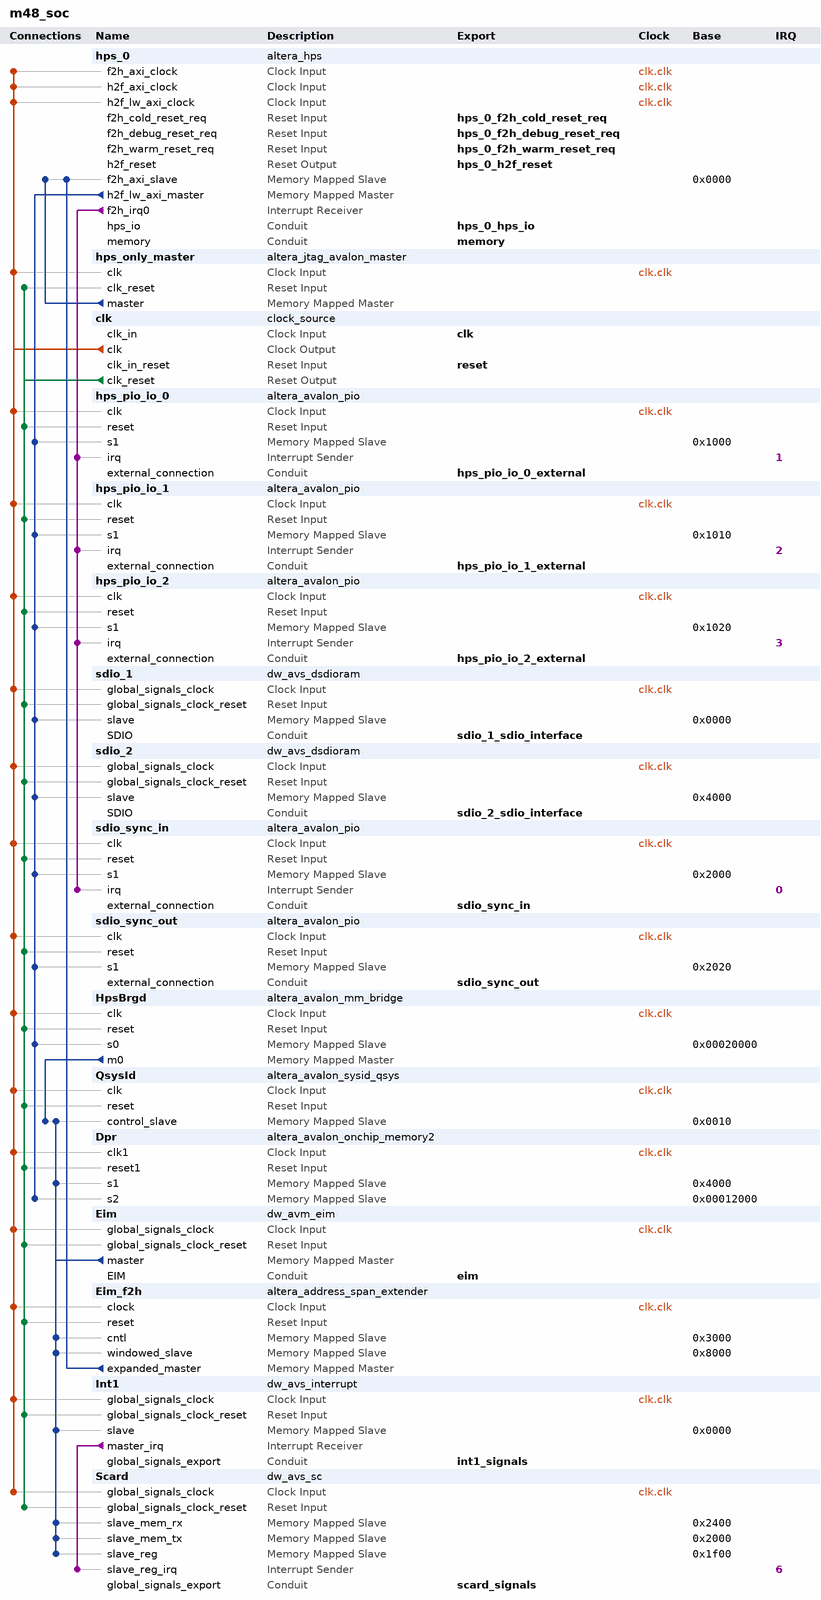
[diagram p0: system contents]
# Platform Designer (Qsys) system m48_soc, Cyclone V 5CSEBA4U23C7
# Parameters at their usual value, and those the tool derives, are not listed.
package require -exact qsys 14.1
create_system m48_soc
set_project_property DEVICE_FAMILY {Cyclone V}
set_project_property DEVICE 5CSEBA4U23C7

add_instance hps_0 altera_hps 14.1
set_instance_parameter_value hps_0 EMAC0_Mode RGMII
set_instance_parameter_value hps_0 EMAC0_PinMuxing {HPS I/O Set 0}
set_instance_parameter_value hps_0 EMAC1_Mode N/A
set_instance_parameter_value hps_0 EMAC1_PinMuxing Unused
set_instance_parameter_value hps_0 F2SCLK_COLDRST_Enable true
set_instance_parameter_value hps_0 F2SCLK_DBGRST_Enable true
set_instance_parameter_value hps_0 F2SCLK_WARMRST_Enable true
set_instance_parameter_value hps_0 F2SINTERRUPT_Enable true
set_instance_parameter_value hps_0 F2S_Width 2
set_instance_parameter_value hps_0 FPGA_PERIPHERAL_OUTPUT_CLOCK_FREQ_EMAC0_GTX_CLK 100
set_instance_parameter_value hps_0 FPGA_PERIPHERAL_OUTPUT_CLOCK_FREQ_EMAC0_MD_CLK 100
set_instance_parameter_value hps_0 FPGA_PERIPHERAL_OUTPUT_CLOCK_FREQ_EMAC1_GTX_CLK 100
set_instance_parameter_value hps_0 FPGA_PERIPHERAL_OUTPUT_CLOCK_FREQ_EMAC1_MD_CLK 100
set_instance_parameter_value hps_0 HLGPI_Enable true
set_instance_parameter_value hps_0 HPS_PROTOCOL DDR3
set_instance_parameter_value hps_0 I2C0_Mode I2C
set_instance_parameter_value hps_0 I2C0_PinMuxing {HPS I/O Set 1}
set_instance_parameter_value hps_0 I2C1_Mode N/A
set_instance_parameter_value hps_0 I2C1_PinMuxing Unused
set_instance_parameter_value hps_0 LWH2F_Enable true
set_instance_parameter_value hps_0 MEM_BANKADDR_WIDTH 3
set_instance_parameter_value hps_0 MEM_CLK_FREQ 400.0
set_instance_parameter_value hps_0 MEM_COL_ADDR_WIDTH 10
set_instance_parameter_value hps_0 MEM_DQ_WIDTH 32
set_instance_parameter_value hps_0 MEM_DRV_STR RZQ/6
set_instance_parameter_value hps_0 MEM_ROW_ADDR_WIDTH 15
set_instance_parameter_value hps_0 MEM_RTT_NOM RZQ/6
set_instance_parameter_value hps_0 MEM_RTT_WR {Dynamic ODT off}
set_instance_parameter_value hps_0 MEM_TCL 7
set_instance_parameter_value hps_0 MEM_TFAW_NS 40.0
set_instance_parameter_value hps_0 MEM_TINIT_US 700
set_instance_parameter_value hps_0 MEM_TRAS_NS 35.0
set_instance_parameter_value hps_0 MEM_TRCD_NS 13.91
set_instance_parameter_value hps_0 MEM_TRFC_NS 260.0
set_instance_parameter_value hps_0 MEM_TRP_NS 13.91
set_instance_parameter_value hps_0 MEM_TRRD_NS 10.0
set_instance_parameter_value hps_0 MEM_TRTP_NS 10.0
set_instance_parameter_value hps_0 MEM_VENDOR Micron
set_instance_parameter_value hps_0 MEM_WTCL 6
set_instance_parameter_value hps_0 QSPI_Mode {1 SS}
set_instance_parameter_value hps_0 QSPI_PinMuxing {HPS I/O Set 0}
set_instance_parameter_value hps_0 REF_CLK_FREQ 25.0
set_instance_parameter_value hps_0 S2F_Width 1
set_instance_parameter_value hps_0 SDIO_Mode {4-bit Data}
set_instance_parameter_value hps_0 SDIO_PinMuxing {HPS I/O Set 0}
set_instance_parameter_value hps_0 SPIM1_Mode N/A
set_instance_parameter_value hps_0 SPIM1_PinMuxing Unused
set_instance_parameter_value hps_0 STM_Enable false
set_instance_parameter_value hps_0 TIMING_BOARD_AC_SKEW 0.02
set_instance_parameter_value hps_0 TIMING_BOARD_AC_TO_CK_SKEW 0.0
set_instance_parameter_value hps_0 TIMING_BOARD_DQ_TO_DQS_SKEW 0.0
set_instance_parameter_value hps_0 TIMING_BOARD_MAX_CK_DELAY 0.2
set_instance_parameter_value hps_0 TIMING_BOARD_MAX_DQS_DELAY 0.2
set_instance_parameter_value hps_0 TIMING_BOARD_SKEW_BETWEEN_DQS 0.02
set_instance_parameter_value hps_0 TIMING_BOARD_SKEW_CKDQS_DIMM_MAX 0.01
set_instance_parameter_value hps_0 TIMING_BOARD_SKEW_CKDQS_DIMM_MIN -0.01
set_instance_parameter_value hps_0 TIMING_BOARD_SKEW_WITHIN_DQS 0.02
set_instance_parameter_value hps_0 TIMING_TDH 200
set_instance_parameter_value hps_0 TIMING_TDQSCK 225
set_instance_parameter_value hps_0 TIMING_TDQSQ 100
set_instance_parameter_value hps_0 TIMING_TDQSS 0.27
set_instance_parameter_value hps_0 TIMING_TDS 200
set_instance_parameter_value hps_0 TIMING_TDSH 0.18
set_instance_parameter_value hps_0 TIMING_TDSS 0.18
set_instance_parameter_value hps_0 TIMING_TIH 200
set_instance_parameter_value hps_0 TIMING_TIS 200
set_instance_parameter_value hps_0 TIMING_TQSH 0.4
set_instance_parameter_value hps_0 TRACE_Mode HPS
set_instance_parameter_value hps_0 TRACE_PinMuxing {HPS I/O Set 0}
set_instance_parameter_value hps_0 UART0_Mode {No Flow Control}
set_instance_parameter_value hps_0 UART0_PinMuxing {HPS I/O Set 2}
set_instance_parameter_value hps_0 USB1_Mode N/A
set_instance_parameter_value hps_0 USB1_PinMuxing Unused
set_instance_parameter_value hps_0 desired_cfg_clk_mhz 100.0
set_instance_parameter_value hps_0 desired_qspi_clk_mhz 400.0

add_instance hps_only_master altera_jtag_avalon_master 14.1

add_instance clk clock_source 14.1
set_instance_parameter_value clk clockFrequency 50000000

add_instance hps_pio_io_0 altera_avalon_pio 14.1
set_instance_parameter_value hps_pio_io_0 bitClearingEdgeCapReg true
set_instance_parameter_value hps_pio_io_0 direction Bidir
set_instance_parameter_value hps_pio_io_0 generateIRQ true
set_instance_parameter_value hps_pio_io_0 width 32

add_instance hps_pio_io_1 altera_avalon_pio 14.1
set_instance_parameter_value hps_pio_io_1 bitClearingEdgeCapReg true
set_instance_parameter_value hps_pio_io_1 direction Bidir
set_instance_parameter_value hps_pio_io_1 generateIRQ true
set_instance_parameter_value hps_pio_io_1 width 32

add_instance hps_pio_io_2 altera_avalon_pio 14.1
set_instance_parameter_value hps_pio_io_2 bitClearingEdgeCapReg true
set_instance_parameter_value hps_pio_io_2 direction Bidir
set_instance_parameter_value hps_pio_io_2 generateIRQ true
set_instance_parameter_value hps_pio_io_2 width 32

add_instance sdio_1 dw_avs_dsdioram 1.0
set_instance_parameter_value sdio_1 BIG_ENDIAN 0
set_instance_parameter_value sdio_1 CRC_CHECK 0
set_instance_parameter_value sdio_1 ILLEGAL_CMD 1

add_instance sdio_2 dw_avs_dsdioram 1.0
set_instance_parameter_value sdio_2 BIG_ENDIAN 0
set_instance_parameter_value sdio_2 CRC_CHECK 0
set_instance_parameter_value sdio_2 ILLEGAL_CMD 1

add_instance sdio_sync_in altera_avalon_pio 14.1
set_instance_parameter_value sdio_sync_in bitClearingEdgeCapReg true
set_instance_parameter_value sdio_sync_in captureEdge true
set_instance_parameter_value sdio_sync_in direction Input
set_instance_parameter_value sdio_sync_in generateIRQ true
set_instance_parameter_value sdio_sync_in irqType EDGE
set_instance_parameter_value sdio_sync_in width 2

add_instance sdio_sync_out altera_avalon_pio 14.1
set_instance_parameter_value sdio_sync_out bitModifyingOutReg true
set_instance_parameter_value sdio_sync_out direction Output
set_instance_parameter_value sdio_sync_out resetValue 3
set_instance_parameter_value sdio_sync_out width 2

add_instance HpsBrgd altera_avalon_mm_bridge 14.1
set_instance_parameter_value HpsBrgd ADDRESS_UNITS SYMBOLS
set_instance_parameter_value HpsBrgd ADDRESS_WIDTH 12
set_instance_parameter_value HpsBrgd DATA_WIDTH 32
set_instance_parameter_value HpsBrgd MAX_PENDING_RESPONSES 1
set_instance_parameter_value HpsBrgd PIPELINE_COMMAND 0
set_instance_parameter_value HpsBrgd PIPELINE_RESPONSE 0
set_instance_parameter_value HpsBrgd USE_AUTO_ADDRESS_WIDTH 1

add_instance QsysId altera_avalon_sysid_qsys 14.1
set_instance_parameter_value QsysId id 1207963661

add_instance Dpr altera_avalon_onchip_memory2 14.1
set_instance_parameter_value Dpr dataWidth 32
set_instance_parameter_value Dpr dualPort true
set_instance_parameter_value Dpr initMemContent false
set_instance_parameter_value Dpr initializationFileName onchip_mem.hex
set_instance_parameter_value Dpr memorySize 8192
set_instance_parameter_value Dpr readDuringWriteMode OLD_DATA
set_instance_parameter_value Dpr singleClockOperation true

add_instance Eim dw_avm_eim 1.0
set_instance_parameter_value Eim BIG_ENDIAN 0

add_instance Eim_f2h altera_address_span_extender 14.1
set_instance_parameter_value Eim_f2h BURSTCOUNT_WIDTH 1
set_instance_parameter_value Eim_f2h DATA_WIDTH 32
set_instance_parameter_value Eim_f2h MASTER_ADDRESS_DEF 0
set_instance_parameter_value Eim_f2h MAX_PENDING_READS 1
set_instance_parameter_value Eim_f2h SLAVE_ADDRESS_WIDTH 12
set_instance_parameter_value Eim_f2h TERMINATE_SLAVE_PORT false

add_instance Int1 dw_avs_interrupt 1.0
set_instance_parameter_value Int1 ADR_INT_MASK 4
set_instance_parameter_value Int1 ADR_INT_PEND 0
set_instance_parameter_value Int1 ADR_MASTER_INT_PEND 8
set_instance_parameter_value Int1 BIG_ENDIAN 0

add_instance Scard dw_avs_sc 1.0
set_instance_parameter_value Scard ADR_BWT 12
set_instance_parameter_value Scard ADR_CLOCK_DIV 0
set_instance_parameter_value Scard ADR_CMC 36
set_instance_parameter_value Scard ADR_CWT 8
set_instance_parameter_value Scard ADR_ETU 4
set_instance_parameter_value Scard ADR_GWT 24
set_instance_parameter_value Scard ADR_I 28
set_instance_parameter_value Scard ADR_IM 32
set_instance_parameter_value Scard ADR_NR_RX 16
set_instance_parameter_value Scard ADR_NR_TX 20
set_instance_parameter_value Scard BIG_ENDIAN 0
set_instance_parameter_value Scard DEFAULT_BWT_VAL 971
set_instance_parameter_value Scard DEFAULT_CLK_DIV 66
set_instance_parameter_value Scard DEFAULT_CWT_VAL 22
set_instance_parameter_value Scard DEFAULT_ETU_DIV_VAL 372
set_instance_parameter_value Scard DEFAULT_GUARD_TIME 2

# connections
add_connection clk.clk Dpr.clk1 clock
add_connection clk.clk Eim.global_signals_clock clock
add_connection clk.clk Eim_f2h.clock clock
add_connection clk.clk hps_0.f2h_axi_clock clock
add_connection clk.clk hps_0.h2f_axi_clock clock
add_connection clk.clk hps_0.h2f_lw_axi_clock clock
add_connection clk.clk hps_only_master.clk clock
add_connection clk.clk hps_pio_io_0.clk clock
add_connection clk.clk hps_pio_io_1.clk clock
add_connection clk.clk hps_pio_io_2.clk clock
add_connection clk.clk HpsBrgd.clk clock
add_connection clk.clk Int1.global_signals_clock clock
add_connection clk.clk QsysId.clk clock
add_connection clk.clk Scard.global_signals_clock clock
add_connection clk.clk sdio_1.global_signals_clock clock
add_connection clk.clk sdio_2.global_signals_clock clock
add_connection clk.clk sdio_sync_in.clk clock
add_connection clk.clk sdio_sync_out.clk clock
add_connection clk.clk_reset Dpr.reset1 reset
add_connection clk.clk_reset Eim.global_signals_clock_reset reset
add_connection clk.clk_reset Eim_f2h.reset reset
add_connection clk.clk_reset hps_only_master.clk_reset reset
add_connection clk.clk_reset hps_pio_io_0.reset reset
add_connection clk.clk_reset hps_pio_io_1.reset reset
add_connection clk.clk_reset hps_pio_io_2.reset reset
add_connection clk.clk_reset HpsBrgd.reset reset
add_connection clk.clk_reset Int1.global_signals_clock_reset reset
add_connection clk.clk_reset QsysId.reset reset
add_connection clk.clk_reset Scard.global_signals_clock_reset reset
add_connection clk.clk_reset sdio_1.global_signals_clock_reset reset
add_connection clk.clk_reset sdio_2.global_signals_clock_reset reset
add_connection clk.clk_reset sdio_sync_in.reset reset
add_connection clk.clk_reset sdio_sync_out.reset reset
add_connection Eim.master Dpr.s1 avalon
set_connection_parameter_value Eim.master/Dpr.s1 baseAddress 0x4000
add_connection Eim.master Eim_f2h.cntl avalon
set_connection_parameter_value Eim.master/Eim_f2h.cntl baseAddress 0x3000
add_connection Eim.master Eim_f2h.windowed_slave avalon
set_connection_parameter_value Eim.master/Eim_f2h.windowed_slave baseAddress 0x8000
add_connection Eim.master Int1.slave avalon
set_connection_parameter_value Eim.master/Int1.slave baseAddress 0x0000
add_connection Eim.master QsysId.control_slave avalon
set_connection_parameter_value Eim.master/QsysId.control_slave baseAddress 0x0010
add_connection Eim.master Scard.slave_mem_rx avalon
set_connection_parameter_value Eim.master/Scard.slave_mem_rx baseAddress 0x2400
add_connection Eim.master Scard.slave_mem_tx avalon
set_connection_parameter_value Eim.master/Scard.slave_mem_tx baseAddress 0x2000
add_connection Eim.master Scard.slave_reg avalon
set_connection_parameter_value Eim.master/Scard.slave_reg baseAddress 0x1f00
add_connection Eim_f2h.expanded_master hps_0.f2h_axi_slave avalon
set_connection_parameter_value Eim_f2h.expanded_master/hps_0.f2h_axi_slave baseAddress 0x0000
add_connection hps_0.h2f_lw_axi_master Dpr.s2 avalon
set_connection_parameter_value hps_0.h2f_lw_axi_master/Dpr.s2 baseAddress 0x00012000
add_connection hps_0.h2f_lw_axi_master hps_pio_io_0.s1 avalon
set_connection_parameter_value hps_0.h2f_lw_axi_master/hps_pio_io_0.s1 baseAddress 0x1000
add_connection hps_0.h2f_lw_axi_master hps_pio_io_1.s1 avalon
set_connection_parameter_value hps_0.h2f_lw_axi_master/hps_pio_io_1.s1 baseAddress 0x1010
add_connection hps_0.h2f_lw_axi_master hps_pio_io_2.s1 avalon
set_connection_parameter_value hps_0.h2f_lw_axi_master/hps_pio_io_2.s1 baseAddress 0x1020
add_connection hps_0.h2f_lw_axi_master HpsBrgd.s0 avalon
set_connection_parameter_value hps_0.h2f_lw_axi_master/HpsBrgd.s0 baseAddress 0x00020000
add_connection hps_0.h2f_lw_axi_master sdio_1.slave avalon
set_connection_parameter_value hps_0.h2f_lw_axi_master/sdio_1.slave baseAddress 0x0000
add_connection hps_0.h2f_lw_axi_master sdio_2.slave avalon
set_connection_parameter_value hps_0.h2f_lw_axi_master/sdio_2.slave baseAddress 0x4000
add_connection hps_0.h2f_lw_axi_master sdio_sync_in.s1 avalon
set_connection_parameter_value hps_0.h2f_lw_axi_master/sdio_sync_in.s1 baseAddress 0x2000
add_connection hps_0.h2f_lw_axi_master sdio_sync_out.s1 avalon
set_connection_parameter_value hps_0.h2f_lw_axi_master/sdio_sync_out.s1 baseAddress 0x2020
add_connection hps_only_master.master hps_0.f2h_axi_slave avalon
set_connection_parameter_value hps_only_master.master/hps_0.f2h_axi_slave baseAddress 0x0000
add_connection HpsBrgd.m0 QsysId.control_slave avalon
set_connection_parameter_value HpsBrgd.m0/QsysId.control_slave baseAddress 0x0010
add_connection hps_0.f2h_irq0 hps_pio_io_0.irq interrupt
set_connection_parameter_value hps_0.f2h_irq0/hps_pio_io_0.irq irqNumber 1
add_connection hps_0.f2h_irq0 hps_pio_io_1.irq interrupt
set_connection_parameter_value hps_0.f2h_irq0/hps_pio_io_1.irq irqNumber 2
add_connection hps_0.f2h_irq0 hps_pio_io_2.irq interrupt
set_connection_parameter_value hps_0.f2h_irq0/hps_pio_io_2.irq irqNumber 3
add_connection hps_0.f2h_irq0 sdio_sync_in.irq interrupt
set_connection_parameter_value hps_0.f2h_irq0/sdio_sync_in.irq irqNumber 0
add_connection Int1.master_irq Scard.slave_reg_irq interrupt
set_connection_parameter_value Int1.master_irq/Scard.slave_reg_irq irqNumber 6

# exported interfaces
add_interface clk clock sink
set_interface_property clk EXPORT_OF clk.clk_in
add_interface eim conduit end
set_interface_property eim EXPORT_OF Eim.EIM
add_interface hps_0_f2h_cold_reset_req reset sink
set_interface_property hps_0_f2h_cold_reset_req EXPORT_OF hps_0.f2h_cold_reset_req
add_interface hps_0_f2h_debug_reset_req reset sink
set_interface_property hps_0_f2h_debug_reset_req EXPORT_OF hps_0.f2h_debug_reset_req
add_interface hps_0_f2h_warm_reset_req reset sink
set_interface_property hps_0_f2h_warm_reset_req EXPORT_OF hps_0.f2h_warm_reset_req
add_interface hps_0_h2f_reset reset source
set_interface_property hps_0_h2f_reset EXPORT_OF hps_0.h2f_reset
add_interface hps_0_hps_io conduit end
set_interface_property hps_0_hps_io EXPORT_OF hps_0.hps_io
add_interface hps_pio_io_0_external conduit end
set_interface_property hps_pio_io_0_external EXPORT_OF hps_pio_io_0.external_connection
add_interface hps_pio_io_1_external conduit end
set_interface_property hps_pio_io_1_external EXPORT_OF hps_pio_io_1.external_connection
add_interface hps_pio_io_2_external conduit end
set_interface_property hps_pio_io_2_external EXPORT_OF hps_pio_io_2.external_connection
add_interface int1_signals conduit end
set_interface_property int1_signals EXPORT_OF Int1.global_signals_export
add_interface memory conduit end
set_interface_property memory EXPORT_OF hps_0.memory
add_interface reset reset sink
set_interface_property reset EXPORT_OF clk.clk_in_reset
add_interface scard_signals conduit end
set_interface_property scard_signals EXPORT_OF Scard.global_signals_export
add_interface sdio_1_sdio_interface conduit end
set_interface_property sdio_1_sdio_interface EXPORT_OF sdio_1.SDIO
add_interface sdio_2_sdio_interface conduit end
set_interface_property sdio_2_sdio_interface EXPORT_OF sdio_2.SDIO
add_interface sdio_sync_in conduit end
set_interface_property sdio_sync_in EXPORT_OF sdio_sync_in.external_connection
add_interface sdio_sync_out conduit end
set_interface_property sdio_sync_out EXPORT_OF sdio_sync_out.external_connection

set_interconnect_requirement {$system} qsys_mm.clockCrossingAdapter HANDSHAKE
set_interconnect_requirement {$system} qsys_mm.insertDefaultSlave false
set_interconnect_requirement {$system} qsys_mm.maxAdditionalLatency 0
set_interconnect_requirement hps_only_master.master qsys_mm.security SECURE

save_system m48_soc.qsys
